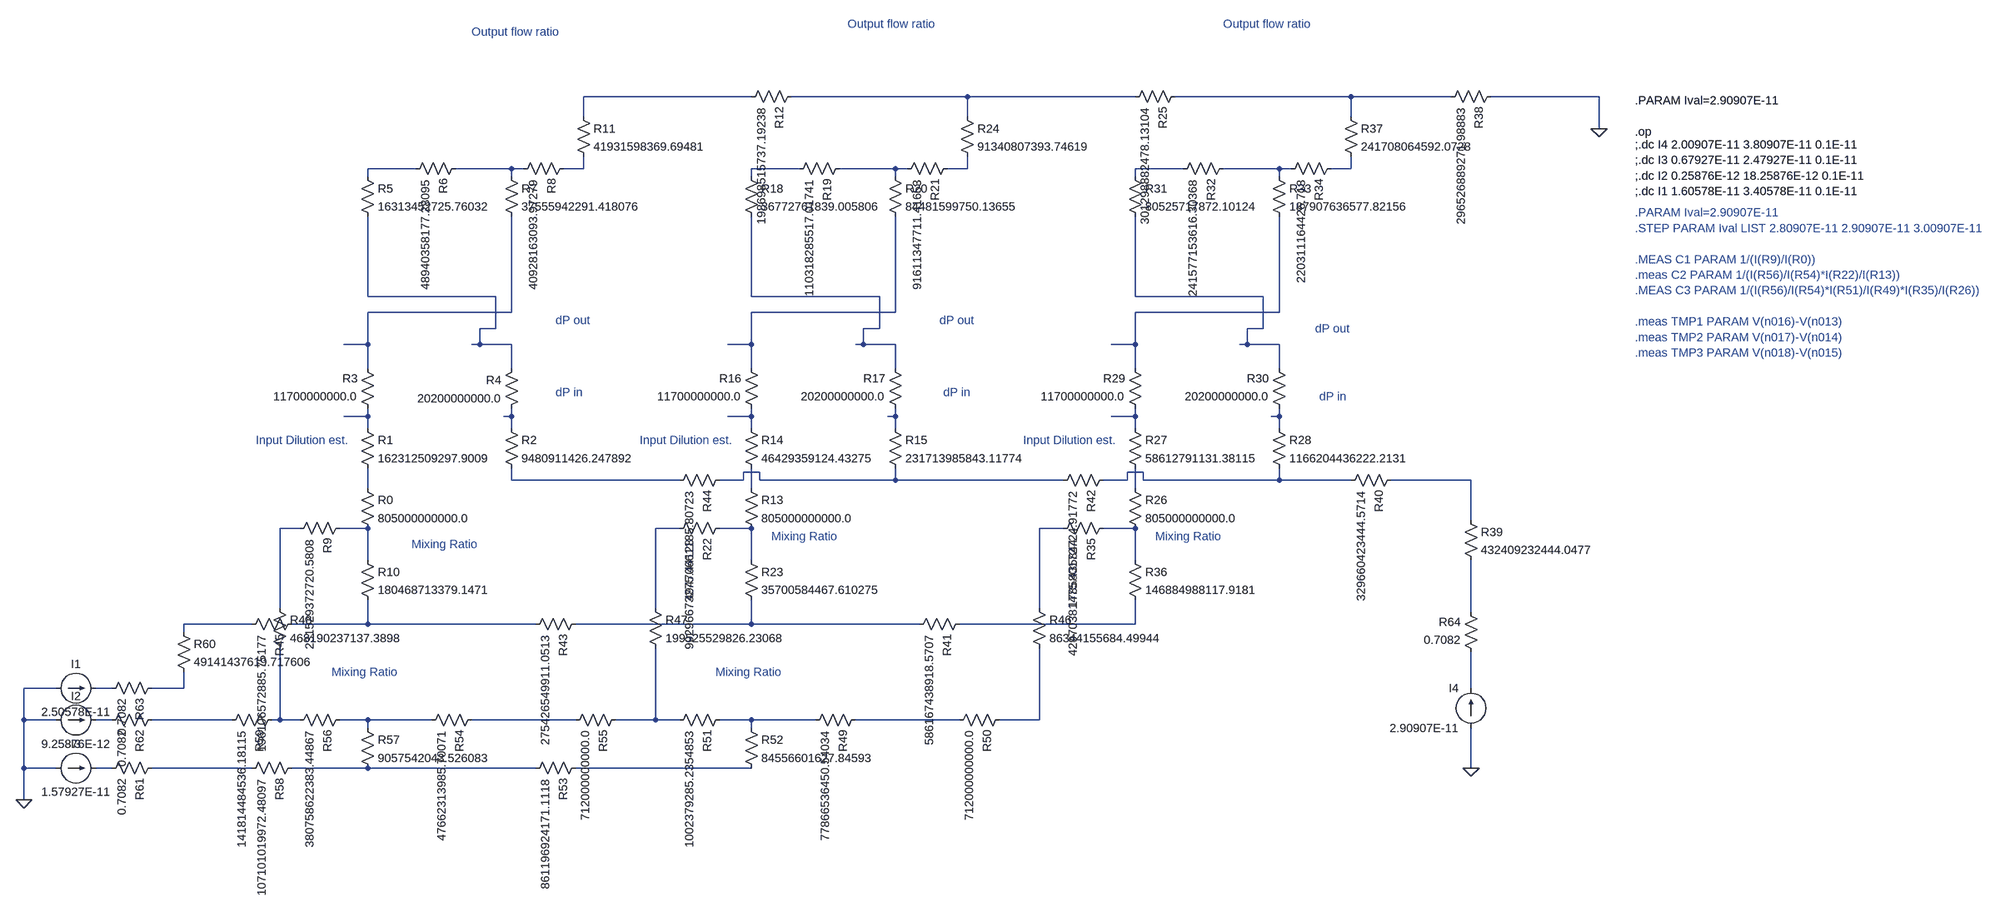
[diagram p0: schematic SPICE_layout_sensitivity.asc]
SPICE_layout_sensitivity.asc, the LTspice schematic file:
Version 4.1
SHEET 1 4016 692
WIRE 1456 -1568 1120 -1568
WIRE 1888 -1568 1536 -1568
WIRE 2224 -1568 1888 -1568
WIRE 2656 -1568 2304 -1568
WIRE 2856 -1568 2656 -1568
WIRE 3152 -1568 2936 -1568
WIRE 1120 -1528 1120 -1568
WIRE 1888 -1528 1888 -1568
WIRE 2656 -1528 2656 -1568
WIRE 3152 -1504 3152 -1568
WIRE 784 -1424 688 -1424
WIRE 976 -1424 864 -1424
WIRE 1000 -1424 976 -1424
WIRE 1120 -1424 1120 -1448
WIRE 1120 -1424 1080 -1424
WIRE 1552 -1424 1456 -1424
WIRE 1744 -1424 1632 -1424
WIRE 1768 -1424 1744 -1424
WIRE 1888 -1424 1888 -1448
WIRE 1888 -1424 1848 -1424
WIRE 2320 -1424 2224 -1424
WIRE 2512 -1424 2400 -1424
WIRE 2536 -1424 2512 -1424
WIRE 2656 -1424 2656 -1448
WIRE 2656 -1424 2616 -1424
WIRE 688 -1408 688 -1424
WIRE 976 -1408 976 -1424
WIRE 1456 -1408 1456 -1424
WIRE 1744 -1408 1744 -1424
WIRE 2224 -1408 2224 -1424
WIRE 2512 -1408 2512 -1424
WIRE 688 -1168 688 -1328
WIRE 944 -1168 688 -1168
WIRE 1456 -1168 1456 -1328
WIRE 1712 -1168 1456 -1168
WIRE 2224 -1168 2224 -1328
WIRE 2480 -1168 2224 -1168
WIRE 976 -1136 976 -1328
WIRE 976 -1136 688 -1136
WIRE 1744 -1136 1744 -1328
WIRE 1744 -1136 1456 -1136
WIRE 2512 -1136 2512 -1328
WIRE 2512 -1136 2224 -1136
WIRE 944 -1104 944 -1168
WIRE 944 -1104 912 -1104
WIRE 1712 -1104 1712 -1168
WIRE 1712 -1104 1680 -1104
WIRE 2480 -1104 2480 -1168
WIRE 2480 -1104 2448 -1104
WIRE 688 -1072 688 -1136
WIRE 688 -1072 640 -1072
WIRE 912 -1072 912 -1104
WIRE 912 -1072 896 -1072
WIRE 976 -1072 912 -1072
WIRE 1456 -1072 1456 -1136
WIRE 1456 -1072 1408 -1072
WIRE 1680 -1072 1680 -1104
WIRE 1680 -1072 1664 -1072
WIRE 1744 -1072 1680 -1072
WIRE 2224 -1072 2224 -1136
WIRE 2224 -1072 2176 -1072
WIRE 2448 -1072 2448 -1104
WIRE 2448 -1072 2432 -1072
WIRE 2512 -1072 2448 -1072
WIRE 688 -1024 688 -1072
WIRE 976 -1024 976 -1072
WIRE 1456 -1024 1456 -1072
WIRE 1744 -1024 1744 -1072
WIRE 2224 -1024 2224 -1072
WIRE 2512 -1024 2512 -1072
WIRE 688 -928 688 -944
WIRE 688 -928 640 -928
WIRE 976 -928 976 -944
WIRE 976 -928 960 -928
WIRE 1456 -928 1456 -944
WIRE 1456 -928 1408 -928
WIRE 1744 -928 1744 -944
WIRE 1744 -928 1728 -928
WIRE 2224 -928 2224 -944
WIRE 2224 -928 2176 -928
WIRE 2512 -928 2512 -944
WIRE 2512 -928 2496 -928
WIRE 688 -904 688 -928
WIRE 976 -904 976 -928
WIRE 1456 -904 1456 -928
WIRE 1744 -904 1744 -928
WIRE 2224 -904 2224 -928
WIRE 2512 -904 2512 -928
WIRE 1472 -816 1440 -816
WIRE 2240 -816 2208 -816
WIRE 976 -800 976 -824
WIRE 1312 -800 976 -800
WIRE 1440 -800 1440 -816
WIRE 1440 -800 1392 -800
WIRE 1472 -800 1472 -816
WIRE 1744 -800 1744 -824
WIRE 1744 -800 1472 -800
WIRE 2080 -800 1744 -800
WIRE 2208 -800 2208 -816
WIRE 2208 -800 2160 -800
WIRE 2240 -800 2240 -816
WIRE 2512 -800 2512 -824
WIRE 2512 -800 2240 -800
WIRE 2656 -800 2512 -800
WIRE 2896 -800 2736 -800
WIRE 688 -784 688 -824
WIRE 1456 -784 1456 -824
WIRE 2224 -784 2224 -824
WIRE 2896 -720 2896 -800
WIRE 552 -704 512 -704
WIRE 688 -704 632 -704
WIRE 1312 -704 1264 -704
WIRE 1456 -704 1392 -704
WIRE 2080 -704 2032 -704
WIRE 2224 -704 2160 -704
WIRE 688 -640 688 -704
WIRE 1456 -640 1456 -704
WIRE 2224 -640 2224 -704
WIRE 512 -544 512 -704
WIRE 1264 -544 1264 -704
WIRE 2032 -544 2032 -704
WIRE 2896 -536 2896 -640
WIRE 456 -512 320 -512
WIRE 688 -512 688 -560
WIRE 688 -512 536 -512
WIRE 1024 -512 688 -512
WIRE 1456 -512 1456 -560
WIRE 1456 -512 1104 -512
WIRE 1792 -512 1456 -512
WIRE 2224 -512 2224 -560
WIRE 2224 -512 1872 -512
WIRE 320 -496 320 -512
WIRE 64 -384 0 -384
WIRE 176 -384 144 -384
WIRE 320 -384 320 -416
WIRE 320 -384 256 -384
WIRE 2896 -384 2896 -456
WIRE 0 -320 0 -384
WIRE 64 -320 0 -320
WIRE 176 -320 144 -320
WIRE 416 -320 256 -320
WIRE 512 -320 512 -464
WIRE 512 -320 496 -320
WIRE 552 -320 512 -320
WIRE 688 -320 632 -320
WIRE 816 -320 688 -320
WIRE 1104 -320 896 -320
WIRE 1264 -320 1264 -464
WIRE 1264 -320 1184 -320
WIRE 1312 -320 1264 -320
WIRE 1456 -320 1392 -320
WIRE 1584 -320 1456 -320
WIRE 1872 -320 1664 -320
WIRE 2032 -320 2032 -464
WIRE 2032 -320 1952 -320
WIRE 688 -304 688 -320
WIRE 1456 -304 1456 -320
WIRE 0 -224 0 -320
WIRE 64 -224 0 -224
WIRE 176 -224 144 -224
WIRE 456 -224 256 -224
WIRE 688 -224 536 -224
WIRE 1024 -224 688 -224
WIRE 1456 -224 1104 -224
WIRE 2896 -224 2896 -304
WIRE 0 -160 0 -224
FLAG 3152 -1504 0
FLAG 2896 -224 0
FLAG 0 -160 0
DATAFLAG 816 -1168 "-I(R4)"
DATAFLAG 816 -1136 "I(R3)"
DATAFLAG 1584 -1168 "I(R17)"
DATAFLAG 1584 -1136 "I(R16)"
DATAFLAG 2352 -1168 "I(R30)"
DATAFLAG 2336 -1136 "I(R29)"
DATAFLAG 640 -1072 "$"
DATAFLAG 896 -1072 "$"
DATAFLAG 1408 -1072 "$"
DATAFLAG 1664 -1072 "$"
DATAFLAG 2176 -1072 "$"
DATAFLAG 2432 -1072 "$"
DATAFLAG 1408 -928 "$"
DATAFLAG 640 -928 "$"
DATAFLAG 2176 -928 "$"
DATAFLAG 1728 -928 "$"
DATAFLAG 2496 -928 "$"
DATAFLAG 960 -928 "$"
DATAFLAG 1872 -928 "V(n021)-V(n022)"
DATAFLAG 1872 -1072 "V(n017)-V(n014)"
DATAFLAG 2624 -912 "V(n023)-V(n024)"
DATAFLAG 2624 -1056 "V(n018)-V(n015)"
DATAFLAG 1088 -928 "V(n020)-V(n019)"
DATAFLAG 1088 -1072 "V(n016)-V(n013)"
DATAFLAG 992 -1760 "I(R6)/I(R7)"
DATAFLAG 1744 -1776 "I(R19)/(I(R20))"
DATAFLAG 2496 -1776 "I(R32)/(I(R33))"
DATAFLAG 848 -624 "I(R9)/I(R10)"
DATAFLAG 560 -832 "1/(I(R9)/I(R0))"
DATAFLAG 1568 -640 "I(R22)/I(R23)"
DATAFLAG 2336 -640 "I(R35)/I(R36)"
DATAFLAG 1328 -832 "1/(I(R56)/I(R54)*I(R22)/I(R13))"
DATAFLAG 2096 -832 "1/(I(R56)/I(R54)*I(R51)/I(R49)*I(R35)/I(R26))"
DATAFLAG 688 -368 "I(R56)/I(R54)"
DATAFLAG 1456 -368 "I(R51)/I(R49)"
SYMBOL res 672 -800 R0
SYMATTR InstName R0
SYMATTR Value 805000000000.0
SYMBOL res 672 -920 R0
SYMATTR InstName R1
SYMATTR Value 162312509297.9009
SYMBOL res 960 -920 R0
SYMATTR InstName R2
SYMATTR Value 9480911426.247892
SYMBOL res 704 -928 R180
WINDOW 0 36 76 Left 2
WINDOW 3 36 40 Left 2
SYMATTR InstName R3
SYMATTR Value 11700000000.0
SYMBOL res 992 -1040 M0
SYMATTR InstName R4
SYMATTR Value 20200000000.0
SYMBOL res 672 -1424 R0
SYMATTR InstName R5
SYMATTR Value 16313452725.76032
SYMBOL res 880 -1440 R90
SYMATTR InstName R6
SYMATTR Value 48940358177.28095
SYMBOL res 960 -1424 R0
SYMATTR InstName R7
SYMATTR Value 37555942291.418076
SYMBOL res 1096 -1440 R90
SYMATTR InstName R8
SYMATTR Value 40928163093.97279
SYMBOL res 648 -720 R90
SYMATTR InstName R9
SYMATTR Value 231529372720.5808
SYMBOL res 672 -656 R0
SYMATTR InstName R10
SYMATTR Value 180468713379.1471
SYMBOL res 1104 -1544 R0
SYMATTR InstName R11
SYMATTR Value 41931598369.69481
SYMBOL res 1552 -1584 R90
SYMATTR InstName R12
SYMATTR Value 198698515737.19238
SYMBOL res 1440 -800 R0
SYMATTR InstName R13
SYMATTR Value 805000000000.0
SYMBOL res 1440 -920 R0
SYMATTR InstName R14
SYMATTR Value 46429359124.43275
SYMBOL res 1728 -920 R0
SYMATTR InstName R15
SYMATTR Value 231713985843.11774
SYMBOL res 1472 -928 R180
WINDOW 0 36 76 Left 2
WINDOW 3 36 40 Left 2
SYMATTR InstName R16
SYMATTR Value 11700000000.0
SYMBOL res 1760 -928 R180
WINDOW 0 36 76 Left 2
WINDOW 3 36 40 Left 2
SYMATTR InstName R17
SYMATTR Value 20200000000.0
SYMBOL res 1440 -1424 R0
SYMATTR InstName R18
SYMATTR Value 36772761839.005806
SYMBOL res 1648 -1440 R90
SYMATTR InstName R19
SYMATTR Value 110318285517.01741
SYMBOL res 1728 -1424 R0
SYMATTR InstName R20
SYMATTR Value 84481599750.13655
SYMBOL res 1864 -1440 R90
SYMATTR InstName R21
SYMATTR Value 91611347711.41653
SYMBOL res 1408 -720 R90
SYMATTR InstName R22
SYMATTR Value 99296673275.44128
SYMBOL res 1440 -656 R0
SYMATTR InstName R23
SYMATTR Value 35700584467.610275
SYMBOL res 1872 -1544 R0
SYMATTR InstName R24
SYMATTR Value 91340807393.74619
SYMBOL res 2320 -1584 R90
SYMATTR InstName R25
SYMATTR Value 301298882478.13104
SYMBOL res 2208 -800 R0
SYMATTR InstName R26
SYMATTR Value 805000000000.0
SYMBOL res 2208 -920 R0
SYMATTR InstName R27
SYMATTR Value 58612791131.38115
SYMBOL res 2496 -920 R0
SYMATTR InstName R28
SYMATTR Value 1166204436222.2131
SYMBOL res 2240 -928 R180
WINDOW 0 36 76 Left 2
WINDOW 3 36 40 Left 2
SYMATTR InstName R29
SYMATTR Value 11700000000.0
SYMBOL res 2528 -928 R180
WINDOW 0 36 76 Left 2
WINDOW 3 36 40 Left 2
SYMATTR InstName R30
SYMATTR Value 20200000000.0
SYMBOL res 2208 -1424 R0
SYMATTR InstName R31
SYMATTR Value 80525717872.10124
SYMBOL res 2416 -1440 R90
SYMATTR InstName R32
SYMATTR Value 241577153616.30368
SYMBOL res 2496 -1424 R0
SYMATTR InstName R33
SYMATTR Value 187907636577.82156
SYMBOL res 2632 -1440 R90
SYMATTR InstName R34
SYMATTR Value 220311164426.718
SYMBOL res 2176 -720 R90
SYMATTR InstName R35
SYMATTR Value 42970381475.435844
SYMBOL res 2208 -656 R0
SYMATTR InstName R36
SYMATTR Value 146884988117.9181
SYMBOL res 2640 -1544 R0
SYMATTR InstName R37
SYMATTR Value 241708064592.0728
SYMBOL res 2952 -1584 R90
SYMATTR InstName R38
SYMATTR Value 296526889271.98883
SYMBOL res 2880 -736 R0
SYMATTR InstName R39
SYMATTR Value 432409232444.0477
SYMBOL res 2752 -816 R90
SYMATTR InstName R40
SYMATTR Value 329660423444.5714
SYMBOL res 1888 -528 R90
SYMATTR InstName R41
SYMATTR Value 586167438918.5707
SYMBOL res 2176 -816 R90
SYMATTR InstName R42
SYMATTR Value 178580172724.91772
SYMBOL res 1120 -528 R90
SYMATTR InstName R43
SYMATTR Value 275426549911.0513
SYMBOL res 1408 -816 R90
SYMATTR InstName R44
SYMATTR Value 49470661185.80723
SYMBOL res 552 -528 R90
SYMATTR InstName R45
SYMATTR Value 196106572885.75177
SYMBOL res 2016 -560 R0
SYMATTR InstName R46
SYMATTR Value 86344155684.49944
SYMBOL res 1248 -560 R0
SYMATTR InstName R47
SYMATTR Value 199525529826.23068
SYMBOL res 496 -560 R0
SYMATTR InstName R48
SYMATTR Value 468190237137.3898
SYMBOL res 1680 -336 R90
SYMATTR InstName R49
SYMATTR Value 77866536450.54034
SYMBOL res 1968 -336 R90
SYMATTR InstName R50
SYMATTR Value 712000000000.0
SYMBOL res 1408 -336 R90
SYMATTR InstName R51
SYMATTR Value 1002379285.2354853
SYMBOL res 1440 -320 R0
SYMATTR InstName R52
SYMATTR Value 84556601627.84593
SYMBOL res 1120 -240 R90
SYMATTR InstName R53
SYMATTR Value 861196924171.1118
SYMBOL res 912 -336 R90
SYMATTR InstName R54
SYMATTR Value 47662313985.70071
SYMBOL res 1200 -336 R90
SYMATTR InstName R55
SYMATTR Value 712000000000.0
SYMBOL res 648 -336 R90
SYMATTR InstName R56
SYMATTR Value 380758622383.44867
SYMBOL res 672 -320 R0
SYMATTR InstName R57
SYMATTR Value 9057542043.526083
SYMBOL res 552 -240 R90
SYMATTR InstName R58
SYMATTR Value 107101019972.48097
SYMBOL res 512 -336 R90
SYMATTR InstName R59
SYMATTR Value 141814484536.18115
SYMBOL res 304 -512 R0
SYMATTR InstName R60
SYMATTR Value 49141437619.717606
SYMBOL res 272 -240 R90
SYMATTR InstName R61
SYMATTR Value 0.7082
SYMBOL res 272 -336 R90
SYMATTR InstName R62
SYMATTR Value 0.7082
SYMBOL res 272 -400 R90
SYMATTR InstName R63
SYMATTR Value 0.7082
SYMBOL res 2912 -440 R180
WINDOW 0 36 76 Left 2
WINDOW 3 36 40 Left 2
SYMATTR InstName R64
SYMATTR Value 0.7082
SYMBOL current 64 -384 R270
WINDOW 0 32 40 VTop 2
WINDOW 3 -32 40 VBottom 2
WINDOW 123 0 0 Left 0
WINDOW 39 0 0 Left 0
SYMATTR InstName I1
SYMATTR Value 2.50578E-11
SYMBOL current 64 -320 R270
WINDOW 0 32 40 VTop 2
WINDOW 3 -32 40 VBottom 2
WINDOW 123 0 0 Left 0
WINDOW 39 0 0 Left 0
SYMATTR InstName I2
SYMATTR Value 9.25876E-12
SYMBOL current 64 -224 R270
WINDOW 0 32 40 VTop 2
WINDOW 3 -32 40 VBottom 2
WINDOW 123 0 0 Left 0
WINDOW 39 0 0 Left 0
SYMATTR InstName I3
SYMATTR Value 1.57927E-11
SYMBOL current 2896 -304 R180
WINDOW 0 24 80 Left 2
WINDOW 3 24 0 Left 2
WINDOW 123 0 0 Left 0
WINDOW 39 0 0 Left 0
SYMATTR InstName I4
SYMATTR Value 2.90907E-11
TEXT 1064 -976 Left 2 ;dP in
TEXT 1064 -1120 Left 2 ;dP out
TEXT 1840 -976 Left 2 ;dP in
TEXT 1832 -1120 Left 2 ;dP out
TEXT 2592 -968 Left 2 ;dP in
TEXT 2584 -1104 Left 2 ;dP out
TEXT 896 -1808 Left 2 ;Output flow ratio
TEXT 1648 -1824 Left 2 ;Output flow ratio
TEXT 2400 -1824 Left 2 ;Output flow ratio
TEXT 776 -672 Left 2 ;Mixing Ratio
TEXT 464 -880 Left 2 ;Input Dilution est.
TEXT 1496 -688 Left 2 ;Mixing Ratio
TEXT 2264 -688 Left 2 ;Mixing Ratio
TEXT 1232 -880 Left 2 ;Input Dilution est.
TEXT 2000 -880 Left 2 ;Input Dilution est.
TEXT 616 -416 Left 2 ;Mixing Ratio
TEXT 1384 -416 Left 2 ;Mixing Ratio
TEXT 3224 -1336 Left 2 ;.PARAM Ival=2.90907E-11\n.STEP PARAM Ival LIST 2.80907E-11 2.90907E-11 3.00907E-11\n \n.MEAS C1 PARAM 1/(I(R9)/I(R0))\n.meas C2 PARAM 1/(I(R56)/I(R54)*I(R22)/I(R13))\n.MEAS C3 PARAM 1/(I(R56)/I(R54)*I(R51)/I(R49)*I(R35)/I(R26))\n \n.meas TMP1 PARAM V(n016)-V(n013)\n.meas TMP2 PARAM V(n017)-V(n014)\n.meas TMP3 PARAM V(n018)-V(n015)\n \n
TEXT 3224 -1560 Left 2 !.PARAM Ival=2.90907E-11\n \n.op
TEXT 3224 -1472 Left 2 !;.dc I4 2.00907E-11 3.80907E-11 0.1E-11\n;.dc I3 0.67927E-11 2.47927E-11 0.1E-11\n;.dc I2 0.25876E-12 18.25876E-12 0.1E-11\n;.dc I1 1.60578E-11 3.40578E-11 0.1E-11

The netlist it stands for:
* SPICE_layout_sensitivity.asc
R0 N029 N033 805000000000.0
R1 N019 N029 162312509297.9009
R2 N020 N027 9480911426.247892
R3 N019 N016 11700000000.0
R4 N013 N020 20200000000.0
R5 N004 N013 16313452725.76032
R6 N005 N004 48940358177.28095
R7 N005 N016 37555942291.418076
R8 N006 N005 40928163093.97279
R9 N033 N032 231529372720.5808
R10 N033 N040 180468713379.1471
R11 N001 N006 41931598369.69481
R12 N002 N001 198698515737.19238
R13 N030 N035 805000000000.0
R14 N021 N030 46429359124.43275
R15 N022 N025 231713985843.11774
R16 N021 N017 11700000000.0
R17 N022 N014 20200000000.0
R18 N007 N014 36772761839.005806
R19 N008 N007 110318285517.01741
R20 N008 N017 84481599750.13655
R21 N009 N008 91611347711.41653
R22 N035 N034 99296673275.44128
R23 N035 N041 35700584467.610275
R24 N002 N009 91340807393.74619
R25 N003 N002 301298882478.13104
R26 N031 N037 805000000000.0
R27 N023 N031 58612791131.38115
R28 N024 N026 1166204436222.2131
R29 N023 N018 11700000000.0
R30 N024 N015 20200000000.0
R31 N010 N015 80525717872.10124
R32 N011 N010 241577153616.30368
R33 N011 N018 187907636577.82156
R34 N012 N011 220311164426.718
R35 N037 N036 42970381475.435844
R36 N037 N042 146884988117.9181
R37 N003 N012 241708064592.0728
R38 0 N003 296526889271.98883
R39 N028 N038 432409232444.0477
R40 N028 N026 329660423444.5714
R41 N042 N041 586167438918.5707
R42 N026 N025 178580172724.91772
R43 N041 N040 275426549911.0513
R44 N025 N027 49470661185.80723
R45 N040 N039 196106572885.75177
R46 N036 N054 86344155684.49944
R47 N034 N051 199525529826.23068
R48 N032 N048 468190237137.3898
R49 N053 N052 77866536450.54034
R50 N054 N053 712000000000.0
R51 N052 N051 1002379285.2354853
R52 N052 N058 84556601627.84593
R53 N058 N057 861196924171.1118
R54 N050 N049 47662313985.70071
R55 N051 N050 712000000000.0
R56 N049 N048 380758622383.44867
R57 N049 N057 9057542043.526083
R58 N057 N056 107101019972.48097
R59 N048 N047 141814484536.18115
R60 N039 N044 49141437619.717606
R61 N056 N055 0.7082
R62 N047 N046 0.7082
R63 N044 N043 0.7082
R64 N045 N038 0.7082
I1 0 N043 2.50578E-11
I2 0 N046 9.25876E-12
I3 0 N055 1.57927E-11
I4 0 N045 2.90907E-11
* dP in
* dP out
* dP in
* dP out
* dP in
* dP out
* Output flow ratio
* Output flow ratio
* Output flow ratio
* Mixing Ratio
* Input Dilution est.
* Mixing Ratio
* Mixing Ratio
* Input Dilution est.
* Input Dilution est.
* Mixing Ratio
* Mixing Ratio
* .PARAM Ival=2.90907E-11
* .STEP PARAM Ival LIST 2.80907E-11 2.90907E-11 3.00907E-11
* .MEAS C1 PARAM 1/(I(R9)/I(R0))
* .meas C2 PARAM 1/(I(R56)/I(R54)*I(R22)/I(R13))
* .MEAS C3 PARAM 1/(I(R56)/I(R54)*I(R51)/I(R49)*I(R35)/I(R26))
* .meas TMP1 PARAM V(n016)-V(n013)
* .meas TMP2 PARAM V(n017)-V(n014)
* .meas TMP3 PARAM V(n018)-V(n015)
.PARAM Ival=2.90907E-11
.op
;.dc I4 2.00907E-11 3.80907E-11 0.1E-11
;.dc I3 0.67927E-11 2.47927E-11 0.1E-11
;.dc I2 0.25876E-12 18.25876E-12 0.1E-11
;.dc I1 1.60578E-11 3.40578E-11 0.1E-11
.backanno
.end